# Altium schematic sheet 3.uC Peripheral.SchDoc: TopLevel Schematic
size A4; Date: 2019/03/06; Author: ZhangPan; Revision: 2.0; SheetNumber: 3; SheetTotal: 4; Size: A4; Contact: 0731-88731029; ProjectName: EVM
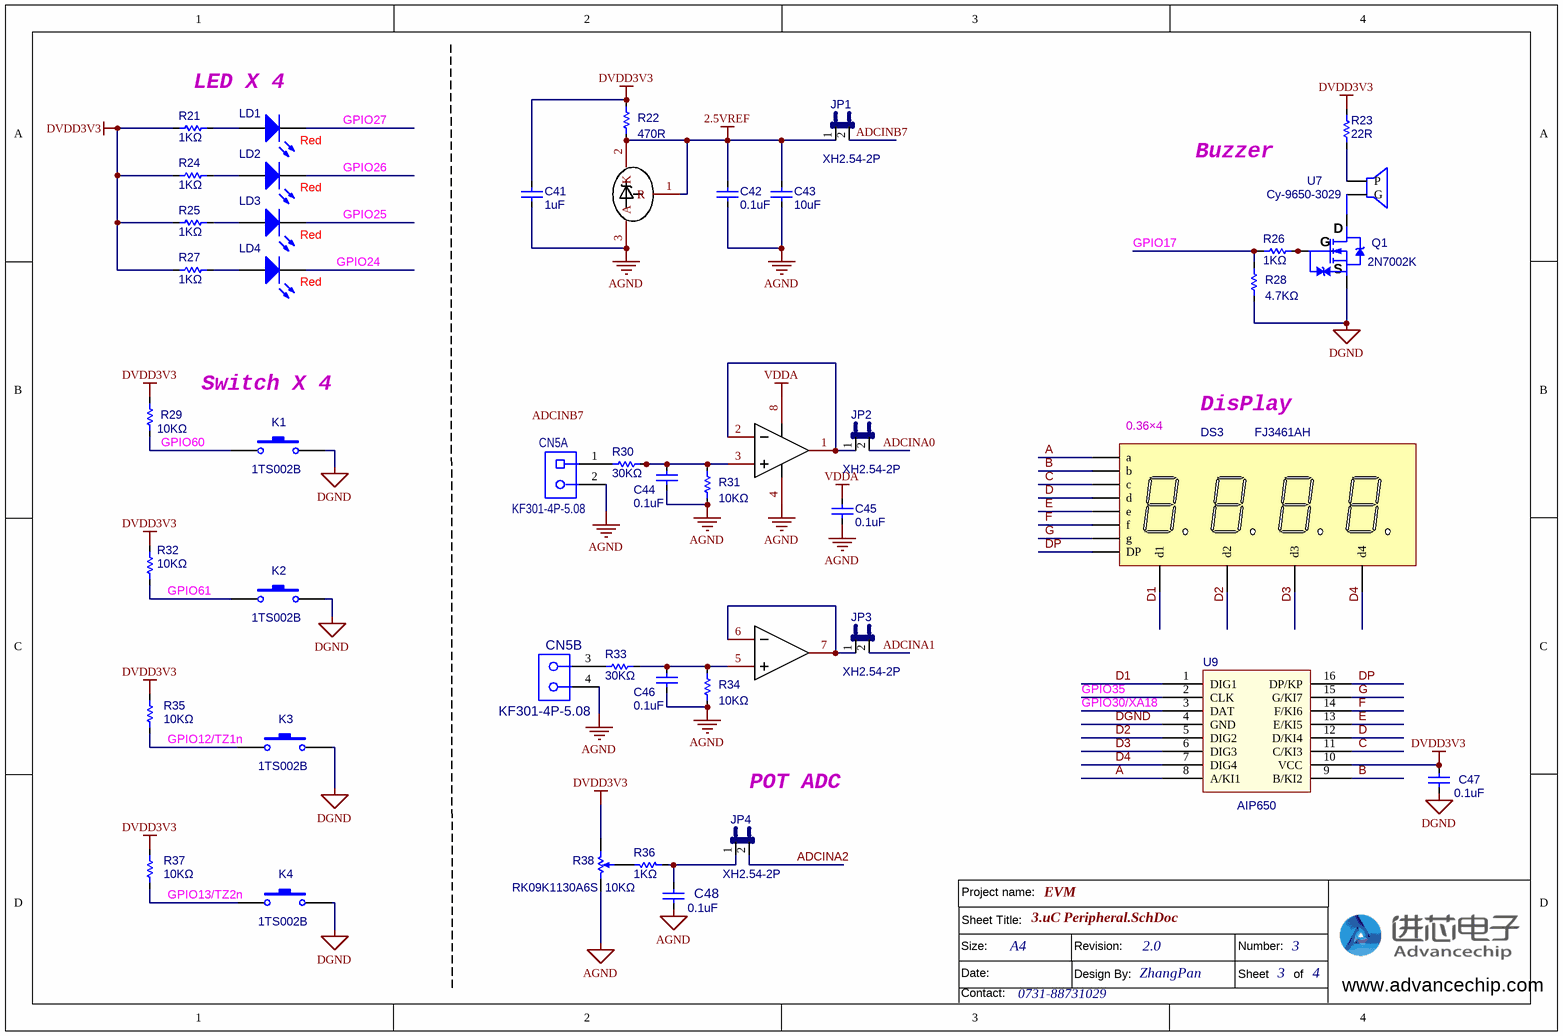
[diagram p0: 3.uC Peripheral.SchDoc]

## Parts
C41  value 1uF  [C0603]  (hidden comment: 0.1uF/50V)
C42  value 0.1uF  [C0603]  (hidden comment: 0.1uF/50V)
C43  value 10uF  [C0603]  (hidden comment: 0.1uF/50V)
C44  value 0.1uF  [C0603]  (hidden comment: 0.1uF/50V)
C45  value 0.1uF  [C0603]  (hidden comment: 0.1uF/50V)
C46  value 0.1uF  [C0603 - duplicate]  (hidden comment: 0.1uF/50V)
C47  value 0.1uF  [C0603]  (hidden comment: 0.1uF/50V)
C48  value 0.1uF  [C0603]  (hidden comment: 0.1uF/50V)
CN5  KF301-4P-5.08  [J-DG128-4]  (parts A,B of 2)
DS3  FJ3461AH  value 0.36×4  [0.36X4]
JP1  XH2.54-2P  [SIP2C]
JP2  XH2.54-2P  [SIP2C]
JP3  XH2.54-2P  [SIP2C]
JP4  XH2.54-2P  [SIP2C]
K1  value 1TS002B  [SW-3X6]  (hidden comment: 1TS002B-2400-5001-CT)
K2  value 1TS002B  [SW-3X6]  (hidden comment: 1TS002B-2400-5001-CT)
K3  value 1TS002B  [SW-3X6]  (hidden comment: 1TS002B-2400-5001-CT)
K4  value 1TS002B  [SW-3X6]  (hidden comment: 1TS002B-2400-5001-CT)
LD1  Red  [SMD_LED0805_LED]
LD2  Red  [SMD_LED0805_LED]
LD3  Red  [SMD_LED0805_LED]
LD4  Red  [SMD_LED0805_LED]
Q1  2N7002K  [MOS-SOT23]
R21  1KΩ  [R0603 - duplicate]
R22  470R  [R0603]
R23  22R  [1206RX]
R24  1KΩ  [R0603]
R25  1KΩ  [R0603]
R26  1KΩ  [R0603]
R27  1KΩ  [R0603]
R28  4.7KΩ  [R0603 - duplicate]
R29  10KΩ  [R0603]
R30  30KΩ  [R0603 - duplicate]
R31  10KΩ  [R0603]
R32  10KΩ  [R0603]
R33  30KΩ  [R0603]
R34  10KΩ  [R0603 - duplicate]
R35  10KΩ  [R0603]
R36  1KΩ  [R0603]
R37  10KΩ  [R0603]
R38  RK09K1130A6S  10KΩ  [RK09K1130]
U6  TL431_C963380  [SOT-23-3_L2.9-W1.4-P1.90-LS2.6-BR]  (value not drawn)
U7  Cy-9650-3029  [SUN-0905-3V]
U8  LM358_C5252902  [SOP-8_L4.9-W3.9-P1.27-LS6.0-BL]  (value not drawn)  (parts A,B of 2)
U9  AIP650  [SOIC-16_150mil]

## Nets
2.5VREF: C42.2 C43.2 JP1.1 R22.2 U6.1(R) U6.2(K)
AGND: C41.1 C42.1 C43.1 C44.1 C45.1 C46.1 C48.2 CN5.2 CN5.4 R31.2 R34.2 R38.1 U6.3(A) U8.4(VEE)
DGND: C47.2 K1.2 K2.2 K3.2 K4.2 Q1.S R28.2 U9.4(GND)
DVDD3V3: C41.2 C47.1 R21.2 R22.1 R23.1 R24.2 R25.2 R27.2 R29.1 R32.1 R35.1 R37.1 R38.3 U9.10(VCC)
VDDA: C45.2 U8.8(VCC)
A: DS3.a U9.8(A/KI1)
ADCINA0: JP2.2
ADCINA1: JP3.2
ADCINA2: JP4.2
ADCINB7: JP1.2
B: DS3.b U9.9(B/KI2)
C: DS3.c U9.11(C/KI3)
D: DS3.d U9.12(D/KI4)
D1: DS3.com1(d1) U9.1(DIG1)
D2: DS3.com2(d2) U9.5(DIG2)
D3: DS3.com3(d3) U9.6(DIG3)
D4: DS3.com4(d4) U9.7(DIG4)
DP: DS3.dp(DP) U9.16(DP/KP)
E: DS3.e U9.13(E/KI5)
F: DS3.f U9.14(F/KI6)
G: DS3.g U9.15(G/KI7)
GPIO12/TZ1n: K3.1 R35.2
GPIO13/TZ2n: K4.1 R37.2
GPIO17: R26.2 R28.1
GPIO24: LD4.2(K)
GPIO25: LD3.2(K)
GPIO26: LD2.2(K)
GPIO27: LD1.2(K)
GPIO30/XA18: U9.3(DAT)
GPIO35: U9.2(CLK)
GPIO60: K1.1 R29.2
GPIO61: K2.1 R32.2
NetC44_2: C44.2 R30.2 R31.1 U8.3(IN1+)
NetC46_2: C46.2 R33.2 R34.1 U8.5(IN2+)
NetC48_1: C48.1 JP4.1 R36.2
NetCN5_1: CN5.1 R30.1
NetCN5_3: CN5.3 R33.1
NetJP2_1: JP2.1 U8.1(OUT1) U8.2(IN1-)
NetJP3_1: JP3.1 U8.6(IN2-) U8.7(OUT2)
NetLD1_1: LD1.1(A) R21.1
NetLD2_1: LD2.1(A) R24.1
NetLD3_1: LD3.1(A) R25.1
NetLD4_1: LD4.1(A) R27.1
NetQ1_D: Q1.D U7.2(G)
NetQ1_G: Q1.G R26.1
NetR23_2: R23.2 U7.1(P)
NetR36_1: R36.1 R38.2

## Notes on the sheet
- LED X 4
- Buzzer
- Switch X 4
- (near DS3) DisPlay
- POT ADC
- Labels drawn without touching a wire or pin: ADCINB7
- Sheet Title:
- Project name:
- Size:
- Date:
- Contact:
- Revision:
- Design By:
- Number:
- Sheet       of
- www.advancechip.com

## Library data of the parts
C41-C48 = Cap: 贴片电容; Published: 8-Jun-2000; LatestRevisionDate: 17-Jul-2002; LatestRevisionNote: Re-released for DXP Platform.; Publisher: Altium Limited
CN5 = CON4: 连接器
DS3 = Dpy Amber-4K: 4位0.36英寸红色共阴七段数码管; 焊接类型: 直插; ComponentLink1URL: *; ComponentLink2Description: *; ComponentLink2URL: *; ComponentLink3Description: *; ComponentLink3URL: *; Pin: 12
JP1-JP4 = JP2: 连接器+跳线帽
K1-K4 = SW-PB: 鸿源精密轻触开关3X6; Published: 24-Mar-1999; LatestRevisionDate: 17-Jul-2002; LatestRevisionNote: Re-released for DXP Platform.; Publisher: Altium Limited
LD1-LD4 = LED0: 发光二极管; Published: 8-Jun-2000; LatestRevisionDate: 08-Jul-2005; LatestRevisionNote: Mech Layer 1 removed.; PackageReference: LED-0; Publisher: Altium Limited; PackageDescription: LED; 2 Leads
Q1 = 2SK3019: N-MOSFET 60V300mA低开启电压; Published: 8-Jun-2000; LatestRevisionDate: 17-Jul-2002; LatestRevisionNote: Re-released for DXP Platform.; Publisher: Altium Limited
R21-R37 = Res: 贴片电阻; Value: 1K; Published: 8-Jun-2000; LatestRevisionDate: 17-Jul-2002; LatestRevisionNote: Re-released for DXP Platform.; Publisher: Altium Limited
R38 = RPot SM: 立式可调电位器; Published: 17-Dec-2003; DatasheetDocument: Oct-2003; Publisher: Altium Limited
U6 = TL431_C963380: Name: TL431; Add into BOM: yes; Input Voltage: 37V; Output Voltage: 2.5V~36V; Minimum Cathode Current for Regulation: 1mA; Symbol: TL431_C963380; Device: TL431_C963380; Supplier Part: C963380; Manufacturer Part: TL431; Supplier Footprint: SOT-23; JLCPCB Part Class: Extended Part; Supplier: LCSC; Convert to PCB: yes; Output Current: -; Tolerance: -; Supply Current: -; Noise - 1/10Hz to 10Hz: -; Noise - 10Hz to 10kHz: -
U7 = BEEP: 超音V有源蜂鸣器 电磁式 脚距5,外径9.5mm
U8 = LM358_C5252902: Name: LM358; Add into BOM: yes; Number of Circuits: 2; Voltage - Input Offset(Vos): 5mV; Gain Bandwidth Product(GBP): 1.2MHz; Symbol: LM358_C5252902; Device: LM358_C5252902; Supplier Part: C5252902; Manufacturer Part: LM358; Supplier Footprint: SOP-8; JLCPCB Part Class: Extended Part; Datasheet: https://atta.szlcsc.com/upload/public/pdf/source/20221111/EFA130B3B4599AE68A453AC9B85C4BC9.pdf; Supplier: LCSC; Convert to PCB: yes
U9 = AIP650E: 无锡中微LED驱动芯片